# Altium schematic sheet Reverse Protection_Section.SchDoc
size 420 x 297 mm; DocumentNumber: 3; SheetNumber: 3; SheetTotal: 17
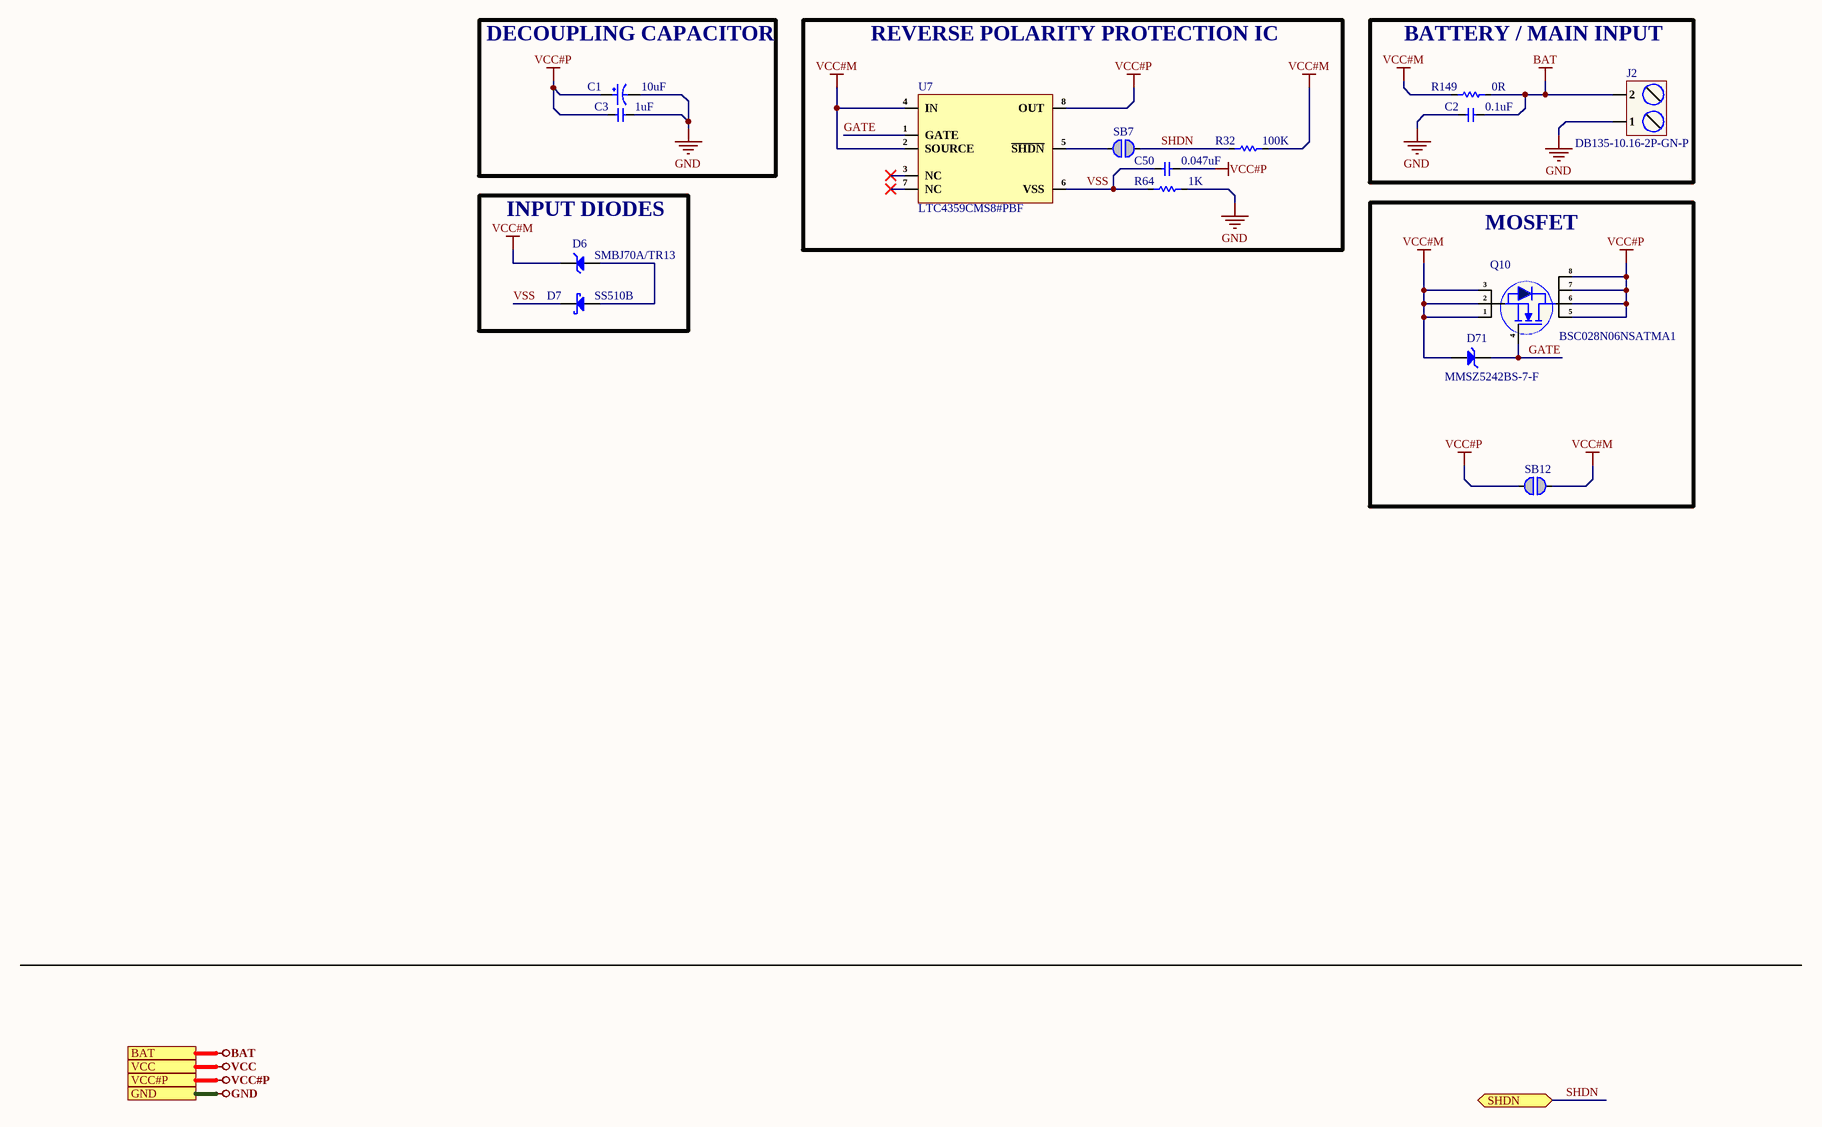
[diagram p0: Reverse Protection_Section.SchDoc]

## Parts
C1  10uF  [RVT1E100M0405_]
C2  0.1uF  [Cap-1206]
C3  1uF  [Cap-0603]
C50  0.047uF  [Cap-1206]
D6  SMBJ70A/TR13  [SMB_]
D7  SS510B  [SMB_]
D71  MMSZ5242BS-7-F  [SOD-323]
J2  DB135-10.16-2P-GN-P  [DB135-10.16-2P-GN-P]
Q10  BSC028N06NSATMA1  [PG-TDSON-8-7]
R32  100K  [RES-0805]
R64  1K  [Res-1206]
R149  0R  [Res-2512]
SB7  Solder Bridge 0603  [Solder Bridge]  (value not drawn)  (no BOM)
SB12  Solder Bridge_1206  [SOLDER BRIDGE-1206_]  (value not drawn)  (no BOM)
U7  LTC4359CMS8#PBF  [MSOP-8]

## Blocks framed on the sheet
DECOUPLING CAPACITOR: C1 C3
REVERSE POLARITY PROTECTION IC: C50 R32 R64 SB7 U7
BATTERY / MAIN INPUT: C2 J2 R149
INPUT DIODES: D6 D7
MOSFET: D71 Q10 SB12

## Ports
BAT, GND, SHDN (bidir), VCC, VCC#P

## Nets
BAT: C2.2 J2.2 R149.2 ; port BAT
GND: C1.2 C2.1 C3.2 J2.1 R64.2 ; port GND
VCC: port VCC
VCC#M: D6.2(K) D71.2(A) Q10.1(S) Q10.2(S) Q10.3(S) R32.2 R149.1 SB12.1 U7.2(SOURCE) U7.4(IN)
VCC#P: C1.1 C3.1 C50.2 Q10.5(D) Q10.6(D) Q10.7(D) Q10.8(D) SB12.2 U7.8(OUT) ; port VCC#P
GATE: D71.1(K) Q10.4(G) U7.1(GATE)
SHDN: R32.1 SB7.1 ; port SHDN
VSS: C50.1 D7.2(K) R64.1 U7.6(VSS)
NetD6_1: D6.1(A) D7.1(A)
NetSB7_2: SB7.2 U7.5(~{SHDN})

Not connected (* = marked no-connect by the designer): U7 3(NC)* 7(NC)*

## Notes on the sheet
- File:
- Title:
- Date:
- Page
- Num:
- Total:
- Drawn By: Huzaifa Ali

## Library data of the parts
C1 = RVT1E100M0405: CAP ALUM 10uF 25V SMD; Manufacturer: ROQANG; φD: 4mm; L: 5.4mm; Tolerance: ±20%; Item Type: Capacitor; Operating Temperature: -45℃~+105℃; Rated Voltage: 25V; Capacitance: 10uF; Manufacturer Part Number: RVT1E100M0405; ComponentLink1Description: LCSC; ComponentLink1URL: https://www.lcsc.com/product-detail/Aluminum-Electrolytic-Capacitors-SMD_10uF-25V-20_C72484.html; LCSC Part Number: C970655
C2 = CC1206KKX7R0BB104: CAP CER 0.1UF 100V X7R 1206; Manufacturer: Yageo; Dielectric Material: Ceramic; Tolerance: 10%; Voltage: 63V; Capacitance: 100nF; Item Type: Capacitor; Supplier 1: Avnet; Manufacturer Part Number: CC1206KKX7R0BB104; RoHS: Yes; Category: Ceramic Capacitors; Stock 1: 24000; Pricing 1: 3000=0.01588, 6000=0.01565, 12000=0.01520, 18000=0.01486, 24000=0.01429, 30000=0.01395, 300000=0.01361 (USD); Mount: Surface Mount; Case/Package: 1206; Number of Pins: 2; Case Code (Metric): 3216; Case Code (Imperial): 1206; Min Operating Temperature: -55°C; Max Operating Temperature: 125°C; Dielectric: X7R; Package Quantity: 1; Voltage Rating: 100V; Packaging: Tape and Reel; Voltage Rating (DC): 100V; Termination: SMD/SMT; Resistor Type: Ceramic; Series: CC; Length: 3.2mm; Width: 0.063inch; Height: 1.25mm; Thickness: 0.057inch; Depth: 1.6mm; Radiation Hardening: No; RoHS Compliant: Yes; Reach SVHC Compliant: Yes; Lead Free: Lead Free; ComponentLink1URL: https://datasheet.ciiva.com/7978/1447671-7978227.pdf?src-supplier=Element14; ComponentLink1Description: https://datasheet.ciiva.com/7978/1447671-7978227.pdf?src-supplier=Element14; ComponentLink2URL: https://datasheet.ciiva.com/46391/1919308-46391993.pdf?src-supplier=Element14; ComponentLink2Description: https://datasheet.ciiva.com/46391/1919308-46391993.pdf?src-supplier=Element14; ComponentLink3URL: https://datasheet.ciiva.com/180/mlccorderingcode-180145.pdf?src-supplier=Digi-Key; ComponentLink3Description: https://datasheet.ciiva.com/180/mlccorderingcode-180145.pdf?src-supplier=Digi-Key; ComponentLink4URL: https://datasheet.ciiva.com/180/mlccorderingcode-180144.pdf?src-supplier=Digi-Key; ComponentLink4Description: https://datasheet.ciiva.com/180/mlccorderingcode-180144.pdf?src-supplier=Digi-Key; ComponentLink5URL: https://datasheet.ciiva.com/180/mlccorderingcode-180146.pdf?src-supplier=Digi-Key; ComponentLink5Description: https://datasheet.ciiva.com/180/mlccorderingcode-180146.pdf?src-supplier=Digi-Key; ComponentLink6URL: https://datasheet.ciiva.com/5425/upy-gp-np0-16v-to-50v-8-5425573.pdf?src-supplier=Mouser; ComponentLink6Description: https://datasheet.ciiva.com/5425/upy-gp-np0-16v-to-50v-8-5425573.pdf?src-supplier=Mouser; ComponentLink7URL: https://datasheet.ciiva.com/16981/upy-np0x7r-mv-100-to-630v-9-16981180.pdf?src-supplier=Future+Electronics; ComponentLink7Description: https://datasheet.ciiva.com/16981/upy-np0x7r-mv-100-to-630v-9-16981180.pdf?src-supplier=Future+Electronics; ComponentLink8URL: https://datasheet.ciiva.com/26829/getdatasheetpartid-403790-26829655.pdf?src-supplier=Verical; ComponentLink8Description: https://datasheet.ciiva.com/26829/getdatasheetpartid-403790-26829655.pdf?src-supplier=Verical; Supplier Part Number 1: CC1206KKX7R0BB104; LCSC Part Number: C107181
C3 = CC0603KRX5R8BB105: CAP CER 1UF 25V X5R 0603; Manufacturer: Yageo; Tolerance: 10%; Item Type: Capacitor; Supplier 1: Digi-Key; Manufacturer Part Number: CC0603KRX5R8BB105; RoHS: Yes; Category: Ceramic Capacitors; Stock 1: 919939; Pricing 1: 1=0.12000, 10=0.08400, 50=0.04760, 100=0.03940, 500=0.02764, 1000=0.02288 (USD); Mount: Surface Mount; Case/Package: 0603; Number of Pins: 2; Case Code (Metric): 1608; Case Code (Imperial): 0603; Min Operating Temperature: -55°C; Max Operating Temperature: 85°C; Capacitance: 1uF; Dielectric: X5R; Package Quantity: 1; Voltage Rating: 25V; Packaging: Tape and Reel; Termination: SMD/SMT; Voltage Rating (DC): 25V; Series: CC; Construction: Flat; Length: 1.6mm; Width: 0.031inch; Height: 0.8mm; Thickness: 0.035inch; Depth: 0.8mm; Radiation Hardening: No; REACH SVHC: No SVHC; Lead Free: Lead Free; Halogen Free: Halogen Free; RoHS Compliant: Yes; ComponentLink1URL: https://datasheet.ciiva.com/176/mlccorderingcode-176785.pdf?src-supplier=Digi-Key; ComponentLink1Description: https://datasheet.ciiva.com/176/mlccorderingcode-176785.pdf?src-supplier=Digi-Key; ComponentLink2URL: https://datasheet.ciiva.com/176/mlccorderingcode-176786.pdf?src-supplier=Digi-Key; ComponentLink2Description: https://datasheet.ciiva.com/176/mlccorderingcode-176786.pdf?src-supplier=Digi-Key; ComponentLink3URL: https://datasheet.ciiva.com/176/mlccorderingcode-176787.pdf?src-supplier=Digi-Key; ComponentLink3Description: https://datasheet.ciiva.com/176/mlccorderingcode-176787.pdf?src-supplier=Digi-Key; ComponentLink4URL: https://datasheet.ciiva.com/17436/upy-gphc-x5r-4v-to-50v-12-17436952.pdf?src-supplier=Avnet+Europe; ComponentLink4Description: https://datasheet.ciiva.com/17436/upy-gphc-x5r-4v-to-50v-12-17436952.pdf?src-supplier=Avnet+Europe; ComponentLink5URL: https://datasheet.ciiva.com/7978/1525783-7978171.pdf?src-supplier=Element14; ComponentLink5Description: https://datasheet.ciiva.com/7978/1525783-7978171.pdf?src-supplier=Element14; ComponentLink6URL: https://datasheet.ciiva.com/11586/upy-gphc-x5r-4v-to-50v-12-11586318.pdf?src-supplier=Avnet; ComponentLink6Description: https://datasheet.ciiva.com/11586/upy-gphc-x5r-4v-to-50v-12-11586318.pdf?src-supplier=Avnet; Supplier Part Number 1: 311-1445-1-ND; LCSC Part Number: C14664
C50 = CC1206JRX7R0BB473: CAP CER 0.047UF 100V X7R 1206; Manufacturer: Yageo; Tolerance: 5%; Capacitance: 47nF; Item Type: Capacitor; Supplier 1: Arrow Electronics; Manufacturer Part Number: CC1206JRX7R0BB473; RoHS: Yes; Category: Ceramic Capacitors; Stock 1: 6600; Pricing 1: 1=0.21620, 10=0.10530, 25=0.10420, 100=0.08480, 250=0.08390, 500=0.05860, 1000=0.05090, 3000=0.04900, 6000=0.02930 (USD); Mount: Surface Mount; Case/Package: 1206; Case Code (Imperial): 1206; Case Code (Metric): 3216; Min Operating Temperature: -55°C; Max Operating Temperature: 125°C; Packaging: Tape and Reel; Voltage Rating (DC): 100V; Dielectric: X7R; Termination: SMD/SMT; Resistor Type: Ceramic; Voltage Rating: 100V; Series: CC; Construction: Flat; Length: 3.2mm; Width: 1.6mm; Height: 0.85mm; Thickness: 0.037inch; Depth: 1.6mm; Radiation Hardening: No; RoHS Compliant: Yes; ComponentLink1URL: https://datasheet.ciiva.com/11465/upy-np0x7r-mv-100-to-630v-9-11465413.pdf?src-supplier=Avnet; ComponentLink1Description: https://datasheet.ciiva.com/11465/upy-np0x7r-mv-100-to-630v-9-11465413.pdf?src-supplier=Avnet; ComponentLink2URL: https://datasheet.ciiva.com/13210/upy-gp-np0-16v-to-50v-8-13210277.pdf?src-supplier=Mouser; ComponentLink2Description: https://datasheet.ciiva.com/13210/upy-gp-np0-16v-to-50v-8-13210277.pdf?src-supplier=Mouser; Supplier Part Number 1: CC1206JRX7R0BB473; LCSC Part Number: C577197
D6 = SMBJ70A/TR13: 5.3A 600W 113V 77.8V 70V SMB(DO-214AA) ESD and Surge Protection (TVS/ESD) ROHS; Manufacturer: Brightking; Item Type: Diode; Manufacturer Part Number: SMBJ70A/TR13; Package: SMB(DO-214AA); LCSC Part Number: C309982; ComponentLink1Description: LCSC; ComponentLink1URL: https://lcsc.com/product-detail/ESD-and-Surge-Protection-TVS-ESD_Brightking-SMBJ70A-TR13_C309982.html?s_z=n_SMBJ70A%252FTR13
D7 = SS510B: SCHOTTKY DIODE SMB 100V 5A; Manufacturer: MDD; Manufacturer Part Number: SS510B; Package: SMB; ComponentLink1Description: LCSC; ComponentLink1URL: https://www.lcsc.com/product-detail/Schottky-Barrier-Diodes-SBD_JUXING-SS510B_C3011128.html; LCSC Part Number: C3011128; Item Type: Diode
D71 = MMSZ5242BS-7-F: DIODE ZENER 12V 200MW SOD323; Manufacturer: Diodes; Supplier: Future Electronics; LCSC Part Number: C151457; Manufacturer Part Number: MMSZ5242BS-7-F; RoHS: Yes; Item Type: Diodes; Stock: 15000; Pricing: 3000=0.0228, 9000=0.022, 15000=0.0216, 60000=0.0206, 90000=0.02 (USD); ComponentLink1URL: https://datasheet.ciiva.com/4734/ds31038-62930-4734288.pdf?src-supplier=Mouser; ComponentLink1Description: https://datasheet.ciiva.com/4734/ds31038-62930-4734288.pdf?src-supplier=Mouser; ComponentLink2URL: https://datasheet.ciiva.com/892/ds31038-892105.pdf?src-supplier=Digikey; ComponentLink2Description: https://datasheet.ciiva.com/892/ds31038-892105.pdf?src-supplier=Digikey; ComponentLink3URL: https://datasheet.ciiva.com/892/ds31038-892106.pdf?src-supplier=Digikey; ComponentLink3Description: https://datasheet.ciiva.com/892/ds31038-892106.pdf?src-supplier=Digikey; ComponentLink4URL: https://datasheet.ciiva.com/892/ds31038-892107.pdf?src-supplier=Digikey; ComponentLink4Description: https://datasheet.ciiva.com/892/ds31038-892107.pdf?src-supplier=Digikey; ComponentLink5URL: https://datasheet.ciiva.com/8347/ds31038-8347977.pdf?src-supplier=Avnet; ComponentLink5Description: https://datasheet.ciiva.com/8347/ds31038-8347977.pdf?src-supplier=Avnet
J2 = DB135-10.16-2P-GN-P: 52A 1x2P -40℃~+105℃ 300V Green Through Hole 10.16mm 1 2 P=10.16mm Screw Terminal Blocks ROHS; Manufacturer: DORABO; Manufacturer Part Number: DB135-10.16-2P-GN-P; Package: P=10.16mm; LCSC Part Number: C2981775; Item Type: Terminal Block; ComponentLink1Description: LCSC; ComponentLink1URL: https://lcsc.com/product-detail/Screw-Terminal-Blocks_DORABO-DB135-10-16-2P-GN-P_C2981775.html
Q10 = BSC028N06NSATMA1: MOSFET N-CH 60V 23A/100A TDSON; Manufacturer: Infineon; Item Type: MOSFETs; Continuous Drain Current (ID): 100A; Rds On Max: 2.8mR; Input Capacitance: 2.7nF; Max Power Dissipation: 83W; Rise Time: 38ns; Turn-On Delay Time: 11ns; Turn-Off Delay Time: 19ns; Fall Time: 8ns; Gate to Source Voltage (Vgs): 20V; Polarity: N-CHANNEL; Supplier: Arrow Electronics; LCSC Part Number: C148250; Manufacturer Part Number: BSC028N06NSATMA1; RoHS: Yes; Stock: 20000; Pricing: 5000=0.8861 (USD); Pins: 8; Contact Plating: Tin; Min Operating Temperature: -55°C; Max Operating Temperature: 150°C; Drain to Source Voltage (Vdss): 60V; Series: OptiMOS™; Packaging: Tape and Reel; Package Quantity: 1; Drain to Source Breakdown Voltage: 60V; Drain to Source Resistance: 2.8mR; Power Dissipation: 83W; Max Dual Supply Voltage: 60V; On-State Resistance: 2.8mR; RoHS Compliant: Yes; Halogen Free: Halogen Free; Lead Free: Contains Lead; ComponentLink1URL: https://datasheet.ciiva.com/6369/infineon-bsc028n06ns-ds-v02-01-en-6369716.pdf?src-supplier=Digikey; ComponentLink1Description: https://datasheet.ciiva.com/6369/infineon-bsc028n06ns-ds-v02-01-en-6369716.pdf?src-supplier=Digikey; ComponentLink2URL: https://datasheet.ciiva.com/11172/infineon-bsc028n06ns-ds-v02-01-en-11172588.pdf?src-supplier=Avnet; ComponentLink2Description: https://datasheet.ciiva.com/11172/infineon-bsc028n06ns-ds-v02-01-en-11172588.pdf?src-supplier=Avnet; ComponentLink3URL: https://datasheet.ciiva.com/6369/infineon-bsc028n06ns-ds-v02-01-en-6369719.pdf?src-supplier=Digikey; ComponentLink3Description: https://datasheet.ciiva.com/6369/infineon-bsc028n06ns-ds-v02-01-en-6369719.pdf?src-supplier=Digikey; ComponentLink4URL: https://datasheet.ciiva.com/6369/infineon-bsc028n06ns-ds-v02-01-en-6369723.pdf?src-supplier=Digikey; ComponentLink4Description: https://datasheet.ciiva.com/6369/infineon-bsc028n06ns-ds-v02-01-en-6369723.pdf?src-supplier=Digikey
R32 = RC0805FR-07100KL: RES 100K OHM 1% 1/8W 0805; Manufacturer: Yageo; Resistance: 100kR; Power Rating: 125mW; Voltage Rating (DC): 150V; Temperature Coefficient: 100ppm/°C; Item Type: Resistor; Supplier 1: Avnet; Manufacturer Part Number: RC0805FR-07100KL; RoHS: Yes; Category: Chip SMD Resistors; Stock 1: 695000; Pricing 1: 5000=0.00227, 10000=0.00224, 20000=0.00217 (USD); Case/Package: 0805; Number of Pins: 2; Case Code (Metric): 2012; Case Code (Imperial): 0805; Size Code: 0805; Min Operating Temperature: -55°C; Max Operating Temperature: 155°C; Resistor Type: Thick Film; Tolerance: 1%; Packaging: Tape and Reel; Voltage Rating: 150V; Package Quantity: 1; Number of Terminations: 2; Termination: SMD/SMT; Max Power Dissipation: 125mW; Features: Moisture Resistant; Series: RC; Construction: Rectangular; Resistance Tolerance: 1%; Technology: THICK FILM; Length: 0.079inch; Width: 0.049inch; Height: 0.024inch; Depth: 1.25mm; Lead Pitch: 0.4mm; Lead Free: Lead Free; RoHS Compliant: Yes; Military Standard: Not; ComponentLink1URL: https://datasheet.ciiva.com/11808/0900766b8106beab-11808858.pdf?src-supplier=RSComponents; ComponentLink1Description: https://datasheet.ciiva.com/11808/0900766b8106beab-11808858.pdf?src-supplier=RSComponents; ComponentLink2URL: https://datasheet.ciiva.com/7941/1686128-7941677.pdf?src-supplier=Element14; ComponentLink2Description: https://datasheet.ciiva.com/7941/1686128-7941677.pdf?src-supplier=Element14; ComponentLink3URL: https://datasheet.ciiva.com/7660/38627-7660796.pdf?src-supplier=Element14; ComponentLink3Description: https://datasheet.ciiva.com/7660/38627-7660796.pdf?src-supplier=Element14; ComponentLink4URL: https://datasheet.ciiva.com/22747/444164-22747534.pdf?src-supplier=Element14; ComponentLink4Description: https://datasheet.ciiva.com/22747/444164-22747534.pdf?src-supplier=Element14; ComponentLink5URL: https://datasheet.ciiva.com/2457/pyu-r-int-thick-7-2457018.pdf?src-supplier=Digi-Key; ComponentLink5Description: https://datasheet.ciiva.com/2457/pyu-r-int-thick-7-2457018.pdf?src-supplier=Digi-Key; ComponentLink6URL: https://datasheet.ciiva.com/2457/pyu-r-int-thick-7-2457019.pdf?src-supplier=Digi-Key; ComponentLink6Description: https://datasheet.ciiva.com/2457/pyu-r-int-thick-7-2457019.pdf?src-supplier=Digi-Key; ComponentLink7URL: https://datasheet.ciiva.com/2457/pyu-r-int-thick-7-2457017.pdf?src-supplier=Digi-Key; ComponentLink7Description: https://datasheet.ciiva.com/2457/pyu-r-int-thick-7-2457017.pdf?src-supplier=Digi-Key; ComponentLink8URL: https://datasheet.ciiva.com/12667/rc0805-12667001.pdf?src-supplier=Mouser; ComponentLink8Description: https://datasheet.ciiva.com/12667/rc0805-12667001.pdf?src-supplier=Mouser; ComponentLink9URL: https://datasheet.ciiva.com/7941/1697719-7941676.pdf?src-supplier=Element14; ComponentLink9Description: https://datasheet.ciiva.com/7941/1697719-7941676.pdf?src-supplier=Element14; ComponentLink10URL: https://datasheet.ciiva.com/7941/1697719-7941678.pdf?src-supplier=Element14; ComponentLink10Description: https://datasheet.ciiva.com/7941/1697719-7941678.pdf?src-supplier=Element14; ComponentLink11URL: https://datasheet.ciiva.com/16747/rc0805-16747226.pdf?src-supplier=Future+Electronics; ComponentLink11Description: https://datasheet.ciiva.com/16747/rc0805-16747226.pdf?src-supplier=Future+Electronics; Supplier Part Number 1: RC0805FR-07100KL; LCSC Part Number: C96346
R64 = RC1206FR-7W1KL: RES 1K OHM 1% 1/2W 1206; Manufacturer: Yageo; Item Type: Resistor; Supplier 1: Digi-Key; Manufacturer Part Number: RC1206FR-7W1KL; RoHS: Yes; Category: Chip SMD Resistors; Stock 1: 6215; Pricing 1: 1=0.19000, 10=0.15700, 100=0.06150, 1000=0.02572, 2500=0.02358 (USD); RoHS Compliant: Yes; Supplier Part Number 1: 13-RC1206FR-7W1KLCT-ND; LCSC Part Number: C859155; ComponentLink1Description: LCSC; ComponentLink1URL: https://www.lcsc.com/product-detail/Chip-Resistor-Surface-Mount_YAGEO-RC1206FR-7W1KL_C859155.html
R149 = 25121WJ0000T4E: 1W Thick Film Resistor 200V ±5% ±800ppm/℃ 0Ω 2512 Chip Resistor - Surface Mount ROHS; Manufacturer: Royal Electronic Factory; Temperature Coefficient: 400ppm/°C; Supplier: Mouser; LCSC Part Number: C25469; Manufacturer Part Number: 25121WJ0000T4E; RoHS: No; Item Type: Resistor; Stock: 12000; Pricing: 10000=0.019 (USD); Value: 0R; ComponentLink1URL: https://datasheet.octopart.com/25121WJ0000T4E-Royal-Ohm-datasheet-165785611.pdf?src-supplier=TME; ComponentLink1Description: https://datasheet.octopart.com/25121WJ0000T4E-Royal-Ohm-datasheet-165785611.pdf?src-supplier=TME
SB7 = Solder Bridge 0603: Solder Bridge ON; Manufacturer Part Number: Solder Bridge; Item Type: Solder Bridge
SB12 = Solder Bridge_1206: Solder Bridge ON; Manufacturer Part Number: Solder Bridge_1206; Item Type: Solder Bridge
U7 = LTC4359CMS8#PBF: IC OR CTRLR N+1 8MSOP; Manufacturer: Analog Devices / Linear Technology; Max Supply Voltage: 80V; Max Output Current: 180mA; Min Supply Voltage: 4V; Turn-On Delay Time: 200us; Turn-Off Delay Time: 300ns; Operating Supply Current: 150uA; Number of Drivers: 1; Supplier 1: Mouser; Manufacturer Part Number: LTC4359CMS8#PBF; RoHS: Yes; Item Type: IC; Stock 1: 57; Pricing 1: 1=4.95000, 10=4.44000, 50=4.19000, 100=3.63000, 1000=3.09000, 10000=3.09000 (USD); Case/Package: MSOP; Number of Pins: 8; Min Operating Temperature: 0°C; Max Operating Temperature: 70°C; Package Quantity: 50; Packaging: Rail/Tube; Lead Free: Lead Free; ComponentLink1URL: https://datasheet.ciiva.com/6609/4359fb-6609306.pdf?src-supplier=Digi-Key; ComponentLink1Description: https://datasheet.ciiva.com/6609/4359fb-6609306.pdf?src-supplier=Digi-Key; Supplier Part Number 1: 584-LTC4359CMS8#PBF